# Altium schematic sheet push-button-switch-5.SchDoc
size A4; SheetNumber: 5; SheetTotal: 17
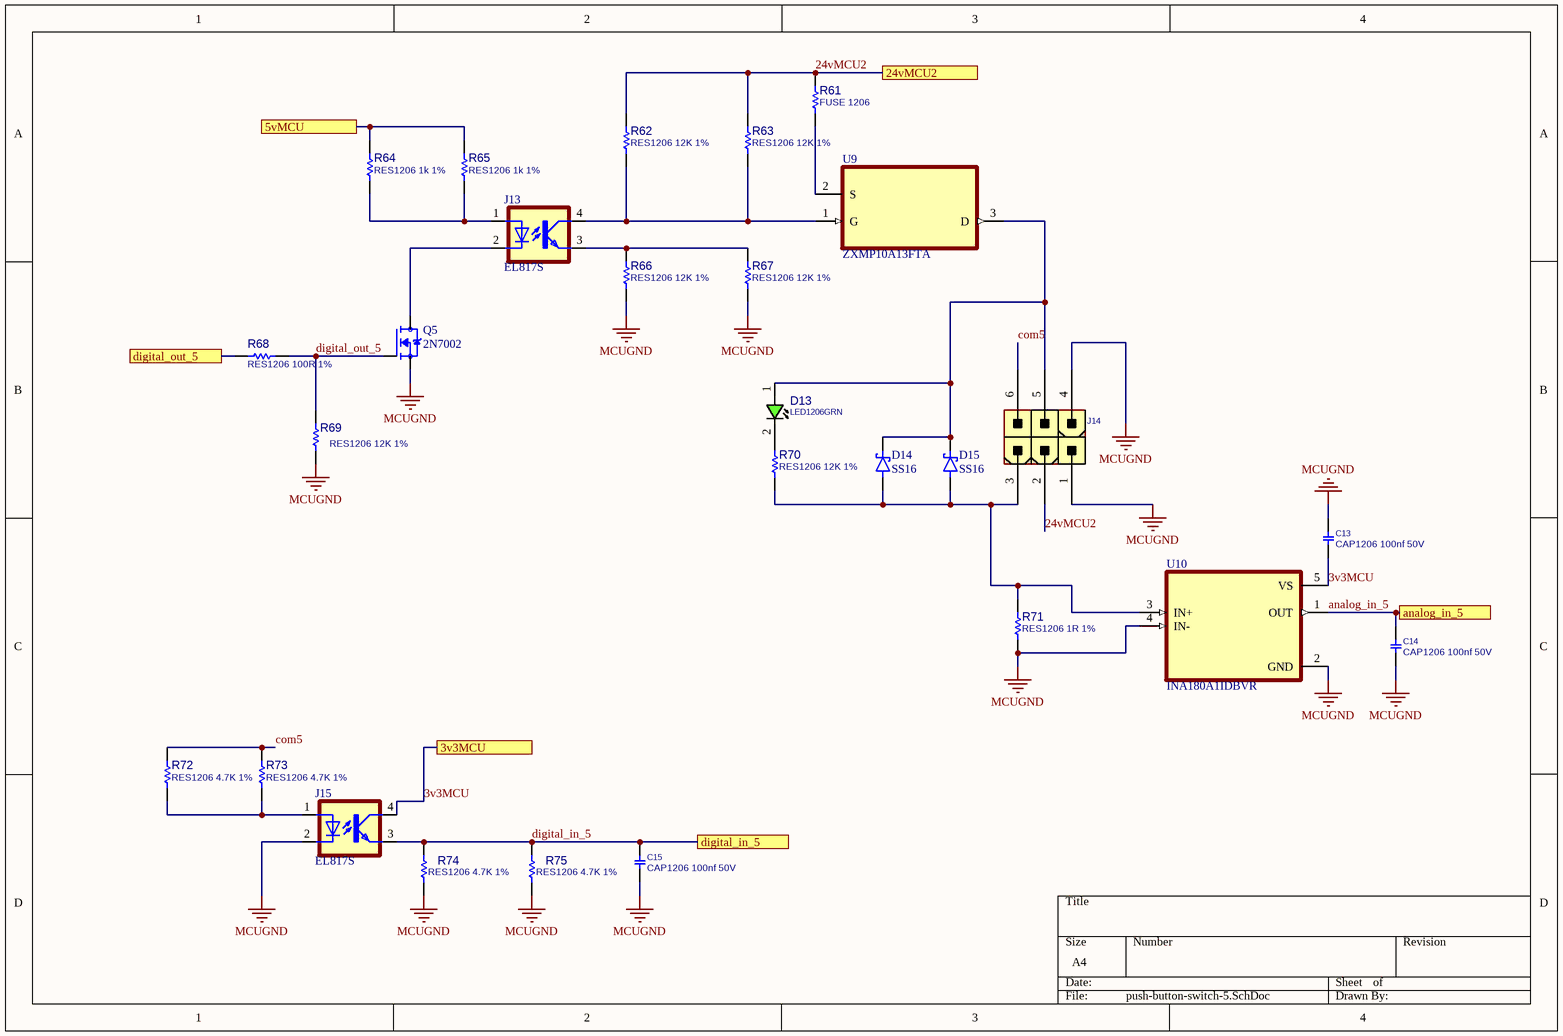
[diagram p0: push-button-switch-5.SchDoc]

## Parts
C13  CAP1206 100nf 50V  [C1206]
C14  CAP1206 100nf 50V  [C1206]
C15  CAP1206 100nf 50V  [C1206]
D13  LED1206GRN  [LED1206GRN]
D14  SS16  [DIOM4325X250N]
D15  SS16  [DIOM4325X250N]
J13  EL817S  [SOIC254P1030X460-4N]
J14  CONN_ATXPWR_6  [ATXPWR_6]  (value not drawn)
J15  EL817S  [SOIC254P1030X460-4N]
Q5  2N7002  [SOT95P240X111-3N]
R61  FUSE 1206  [R1206]
R62  RES1206 12K 1%  [R1206]
R63  RES1206 12K 1%  [R1206]
R64  RES1206 1k 1%  [R1206]
R65  RES1206 1k 1%  [R1206]
R66  RES1206 12K 1%  [R1206]
R67  RES1206 12K 1%  [R1206]
R68  RES1206 100R 1%  [R1206]
R69  RES1206 12K 1%  [R1206]
R70  RES1206 12K 1%  [R1206]
R71  RES1206 1R 1%  [R1206]
R72  RES1206 4.7K 1%  [R1206]
R73  RES1206 4.7K 1%  [R1206]
R74  RES1206 4.7K 1%  [R1206]
R75  RES1206 4.7K 1%  [R1206]
U9  ZXMP10A13FTA  [SOT95P230X110-3N]
U10  INA180A1IDBVR  [SOT95P280X145-5N]

## Ports
3v3MCU, 5vMCU, 24vMCU2, analog_in_5, digital_in_5, digital_out_5

## Nets
MCUGND: C13.1 C14.2 C15.2 J14.1 J14.4 J15.2(C) Q5.2(S) R66.2 R67.2 R69.2 R71.2 R74.1 R75.1 U10.2(GND) U10.4(IN-)
3v3MCU: C13.2 J15.4(COL) U10.5(VS) ; port 3v3MCU
5vMCU: R64.2 R65.2 ; port 5vMCU
24vMCU2: J14.2 R61.1 R62.1 R63.1 ; port 24vMCU2
analog_in_5: C14.1 U10.1(OUT) ; port analog_in_5
com5: J14.6 R72.2 R73.2
digital_in_5: C15.1 J15.3(EMIT) R74.2 R75.2 ; port digital_in_5
digital_out_5: Q5.1(G) R68.2 R69.1
digital_out_5: R68.1 ; port digital_out_5  [a separate net that carries the same name]
NetD13_1: D13.1(ANODE) D14.C(K) D15.C(K) J14.5 U9.3(D)
NetD13_2: D13.2(CATHODE) R70.1
NetD14_A: D14.A D15.A J14.3 R70.2 R71.1 U10.3(IN+)
NetJ13_1: J13.1(A) R64.1 R65.1
NetJ13_2: J13.2(C) Q5.3(D)
NetJ13_3: J13.3(EMIT) R66.1 R67.1
NetJ13_4: J13.4(COL) R62.2 R63.2 U9.1(G)
NetJ15_1: J15.1(A) R72.1 R73.1
NetR61_2: R61.2 U9.2(S)

## Library data of the parts
C13-C15 = CAP_SMD_MLCC_1206: CAP, MLCC; PARAM: -, -%; MANF_P#: MANF_PART#; PARAM2: -V; PRICE: 100= 1$; MANF: -; ASSEMBLY: ASSEMBLY
D13 = LED_SMD_1206_GRN: LED, SMD, 1206, GREEN; PARAM: 20mA; DESC: DESCRIPTION; PARAM2: 2.2V; MANF: -; ASSEMBLY: ASSEMBLY; PRICE: 36t@Javan; MANF_P#: -; VALUE: LED1206GRN; MountType: SMT; PartType: LED
D14 D15 = SS14: 1A, 40V, Schottky Rectifier; MF: Taiwan Semiconductor; SnapEDA_Link: https://www.snapeda.com/parts/SS14/taiwan/view-part/?ref=snap; Package: SMA-2 Taiwan Semiconductor; Value: *; MP: SS14; Check_prices: https://www.snapeda.com/parts/SS14/taiwan/view-part/?ref=eda
J13 J15 = EL817S: Optoisolator Transistor Output 5000Vrms 1 Channel 4-SMD; MF: Everlight Electronics; SnapEDA_Link: https://www.snapeda.com/parts/EL817S/Everlight+Electronics+Co+Ltd/view-part/?ref=snap; Package: SMD-4 Everlight Electronics Co Ltd; Value: *; MP: EL817S; Check_prices: https://www.snapeda.com/parts/EL817S/Everlight+Electronics+Co+Ltd/view-part/?ref=eda
J14 = CONN_ATXPWR_6: CONN, ATX POWER, 6 P; MANF: TE; MANF_P#: 4-1775099-1; VALUE: CONN_ATXPWR_6; MountType: THD; PACKAGE: ATXPWR-6pin; Part Type: Conn.
Q5 = 2N7002: N-Channel 60V 280mA (Ta) 350mW (Ta) Surface Mount SOT-23-3 (TO-236); MF: {'manufacturer': u'onsemi'}; Package: None; Price: None; Value: *; MP: 2N7002; Availability: Unavailable
R61-R75 = RES_SMD_1206: RESISTOR, SMD; PARAM: 1%, 0.25W; DESC: DESCRIPTION; DIST#: MOUSER; MANF_P#: -; MANF: -; ASSEMBLY: ASSEMBLY; PRICE: -; PARAM2: -
U9 = ZXMP10A13FTA: P-Channel 100 V 600mA (Ta) 625mW (Ta) Surface Mount SOT-23-3; MF: Diodes Inc.; Purchase-URL: https://pricing.snapeda.com/search/part/ZXMP10A13FTA/?ref=eda; Package: SOT-23-3 Diodes Inc.; SnapEDA_Link: https://www.snapeda.com/parts/ZXMP10A13FTA/Diodes+Inc./view-part/?ref=snap; Availability: In Stock; Value: *; MP: ZXMP10A13FTA; Check_prices: https://www.snapeda.com/parts/ZXMP10A13FTA/Diodes+Inc./view-part/?ref=eda; Price: None
U10 = INA180A1IDBVR: 26V, 350kHz current sense amplifier; MF: Texas Instruments; SnapEDA_Link: https://www.snapeda.com/parts/INA180A1IDBVR/Texas+Instruments/view-part/?ref=snap; Package: SOT-23-5 Texas Instruments; Value: *; MP: INA180A1IDBVR; Check_prices: https://www.snapeda.com/parts/INA180A1IDBVR/Texas+Instruments/view-part/?ref=eda